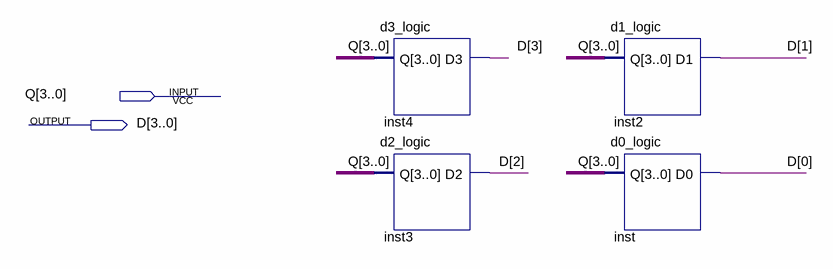
[diagram p0: schematic sheet]
// Quartus schematic next_state.bdf as structural Verilog: 4 symbols, 2 pins
module next_state (
  input  [3:0] Q,
  output [3:0] D
);

  d3_logic inst4 (.Q(Q), .D3(D[3]));
  d2_logic inst3 (.Q(Q), .D2(D[2]));
  d1_logic inst2 (.Q(Q), .D1(D[1]));
  d0_logic inst (.Q(Q), .D0(D[0]));
endmodule
